# Altium project Grantiot.PrjPcb (part 2 of 2)

## Sheet Controller_Section.SchDoc
size A4; DocumentNumber: 4; SheetNumber: 5; SheetTotal: 9
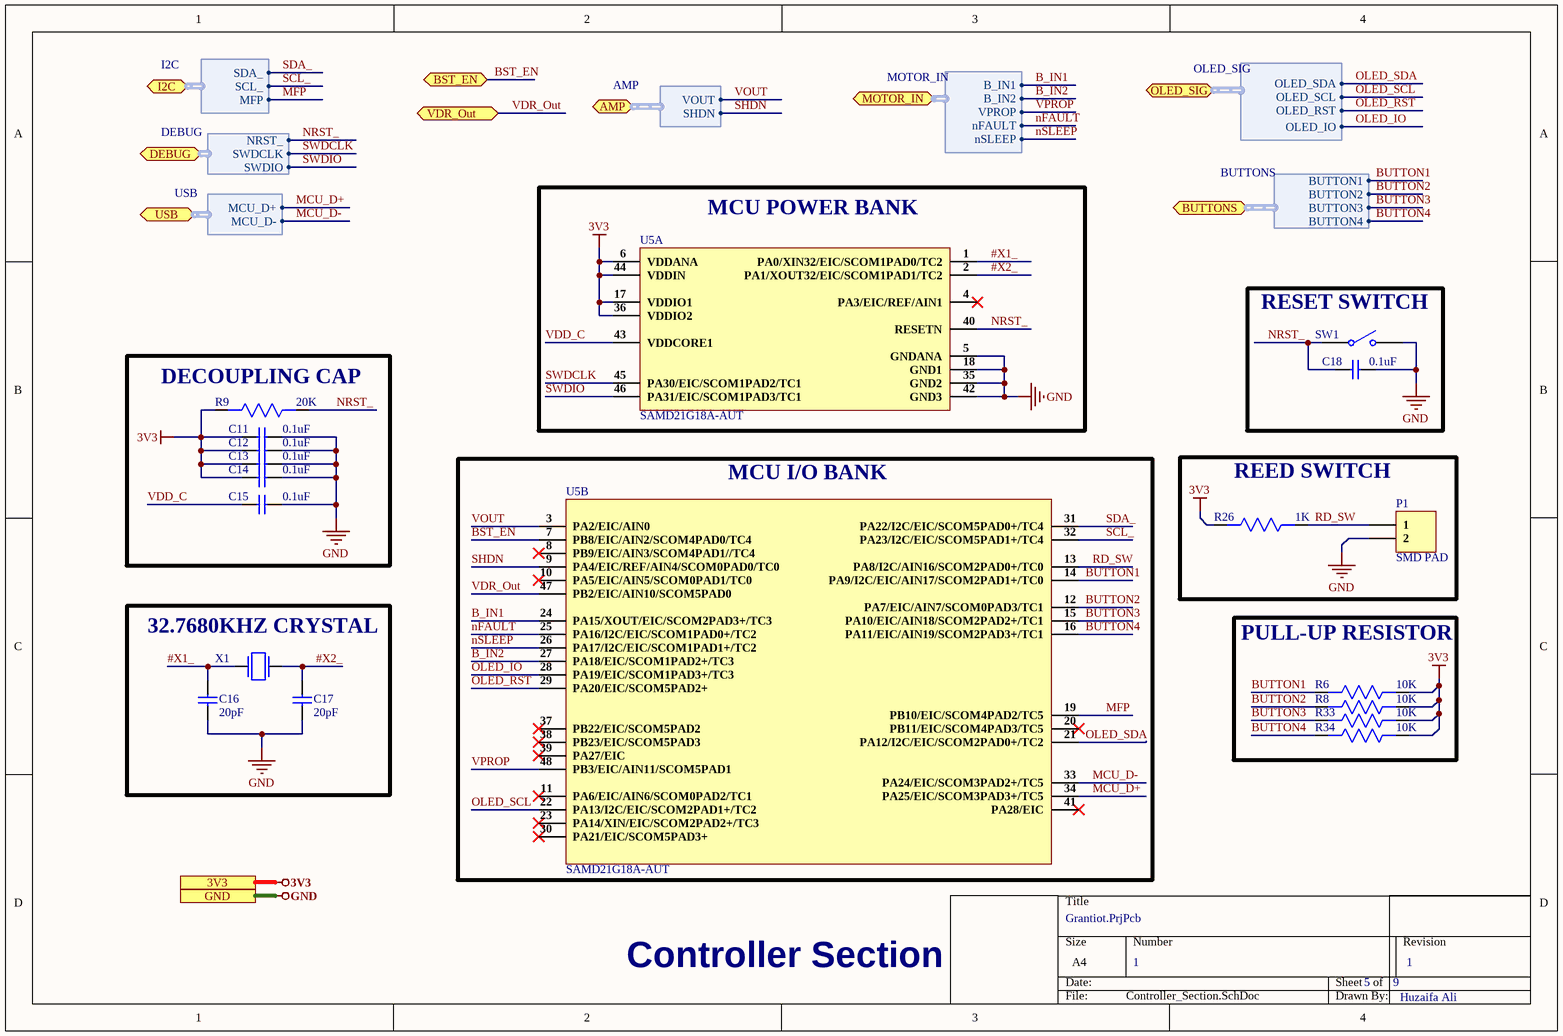
[diagram p3: Controller_Section.SchDoc]

### Parts
C11  0.1uF  [Cap 0402]
C12  0.1uF  [Cap 0402]
C13  0.1uF  [Cap 0402]
C14  0.1uF  [Cap 0402]
C15  0.1uF  [Cap 0402]
C16  20pF  [Cap 0201]
C17  20pF  [Cap 0201]
C18  0.1uF  [Cap 0402]
P1  SMD PAD  [SMD PAD]
R6  10K  [Res0402]
R8  10K  [Res0402]
R9  20K  [Res0402]
R26  1K  [Res0402]
R33  10K  [Res0402]
R34  10K  [Res0402]
SW1  B3U-1000P  [B3U-1000P]  (value not drawn)
U5  SAMD21G18A-AUT  [SAMD21G18A-AUT]  (parts A,B of 2)
X1  NX3215SA-32.768K-STD-MUA-8  [NX3215SA-32.768K-STD-MUA-8]  (value not drawn)

### Blocks framed on the sheet
MCU POWER BANK: U5
RESET SWITCH: C18 SW1
DECOUPLING CAP: C11-C15 R9
MCU I/O BANK: U5
REED SWITCH: P1 R26
32.7680KHZ CRYSTAL: C16 C17 X1
PULL-UP RESISTOR: R6 R8 R33 R34

### Ports
3V3, AMP (bidir, harness AMP), BST_EN (bidir), BUTTONS (bidir, harness BUTTONS), DEBUG (bidir, harness DEBUG), GND, I2C (bidir, harness I2C), MOTOR_IN (bidir, harness MOTOR_IN), OLED_SIG (bidir, harness OLED_SIG), USB (bidir, harness USB), VDR_Out (bidir)

### Harnesses
USB: MCU_D+, MCU_D-
DEBUG: NRST_, SWDCLK, SWDIO
I2C: SDA_, SCL_, MFP
AMP: VOUT, SHDN
MOTOR_IN: B_IN1, B_IN2, VPROP, nFAULT, nSLEEP
OLED_SIG: OLED_SDA, OLED_SCL, OLED_RST, OLED_IO
BUTTONS: BUTTON1, BUTTON2, BUTTON3, BUTTON4

### Nets
3V3: C11.1 C12.1 C13.1 C14.1 R6.1 R8.1 R9.2 R26.2 R33.1 R34.1 U5.6(VDDANA) U5.17(VDDIO1) U5.36(VDDIO2) U5.44(VDDIN) ; port 3V3
GND: C11.2 C12.2 C13.2 C14.2 C15.2 C16.1 C17.1 C18.2 P1.2 SW1.2 U5.5(GNDANA) U5.18(GND1) U5.35(GND2) U5.42(GND3) ; port GND
#X1_: C16.2 U5.1(PA0/XIN32/EIC/SCOM1PAD0/TC2) X1.2
#X2_: C17.2 U5.2(PA1/XOUT32/EIC/SCOM1PAD1/TC2) X1.1
B_IN1: U5.24(PA15/XOUT/EIC/SCOM2PAD3+/TC3) ; port MOTOR_IN.B_IN1
B_IN2: U5.27(PA18/EIC/SCOM1PAD2+/TC3) ; port MOTOR_IN.B_IN2
BST_EN: U5.7(PB8/EIC/AIN2/SCOM4PAD0/TC4) ; port BST_EN
BUTTON1: R6.2 U5.14(PA9/I2C/EIC/AIN17/SCOM2PAD1+/TC0) ; port BUTTONS.BUTTON1
BUTTON2: R8.2 U5.12(PA7/EIC/AIN7/SCOM0PAD3/TC1) ; port BUTTONS.BUTTON2
BUTTON3: R33.2 U5.15(PA10/EIC/AIN18/SCOM2PAD2+/TC1) ; port BUTTONS.BUTTON3
BUTTON4: R34.2 U5.16(PA11/EIC/AIN19/SCOM2PAD3+/TC1) ; port BUTTONS.BUTTON4
MCU_D+: U5.34(PA25/EIC/SCOM3PAD3+/TC5) ; port USB.MCU_D+
MCU_D-: U5.33(PA24/EIC/SCOM3PAD2+/TC5) ; port USB.MCU_D-
MFP: U5.19(PB10/EIC/SCOM4PAD2/TC5) ; port I2C.MFP
nFAULT: U5.25(PA16/I2C/EIC/SCOM1PAD0+/TC2) ; port MOTOR_IN.nFAULT
NRST_: C18.1 R9.1 SW1.1 U5.40(RESETN) ; port DEBUG.NRST_
nSLEEP: U5.26(PA17/I2C/EIC/SCOM1PAD1+/TC2) ; port MOTOR_IN.nSLEEP
OLED_IO: U5.28(PA19/EIC/SCOM1PAD3+/TC3) ; port OLED_SIG.OLED_IO
OLED_RST: U5.29(PA20/EIC/SCOM5PAD2+) ; port OLED_SIG.OLED_RST
OLED_SCL: U5.22(PA13/I2C/EIC/SCOM2PAD1+/TC2) ; port OLED_SIG.OLED_SCL
OLED_SDA: U5.21(PA12/I2C/EIC/SCOM2PAD0+/TC2) ; port OLED_SIG.OLED_SDA
RD_SW: P1.1 R26.1 U5.13(PA8/I2C/AIN16/SCOM2PAD0+/TC0)
SCL_: U5.32(PA23/I2C/EIC/SCOM5PAD1+/TC4) ; port I2C.SCL_
SDA_: U5.31(PA22/I2C/EIC/SCOM5PAD0+/TC4) ; port I2C.SDA_
SHDN: U5.9(PA4/EIC/REF/AIN4/SCOM0PAD0/TC0) ; port AMP.SHDN  [project net AMP.SHDN]
SWDCLK: U5.45(PA30/EIC/SCOM1PAD2/TC1) ; port DEBUG.SWDCLK
SWDIO: U5.46(PA31/EIC/SCOM1PAD3/TC1) ; port DEBUG.SWDIO
VDD_C: C15.1 U5.43(VDDCORE1)
VDR_Out: U5.47(PB2/EIC/AIN10/SCOM5PAD0) ; port VDR_Out
VOUT: U5.3(PA2/EIC/AIN0) ; port AMP.VOUT  [project net AMP.VOUT]
VPROP: U5.48(PB3/EIC/AIN11/SCOM5PAD1) ; port MOTOR_IN.VPROP

Not connected (* = marked no-connect by the designer): U5 4(PA3/EIC/REF/AIN1)* 8(PB9/EIC/AIN3/SCOM4PAD1//TC4)* 10(PA5/EIC/AIN5/SCOM0PAD1/TC0)* 11(PA6/EIC/AIN6/SCOM0PAD2/TC1)* 20(PB11/EIC/SCOM4PAD3/TC5)* 23(PA14/XIN/EIC/SCOM2PAD2+/TC3)* 30(PA21/EIC/SCOM5PAD3+)* 37(PB22/EIC/SCOM5PAD2)* 38(PB23/EIC/SCOM5PAD3)* 39(PA27/EIC)* 41(PA28/EIC)*

### Notes on the sheet
- Controller Section
- 1
- Huzaifa Ali

### Library data of the parts
C11-C15 C18 = CC0402KRX7R7BB104: CAP CER 0.1UF 16V X7R 0402; Manufacturer: Yageo; Tolerance: 10%; Capacitance: 100nF; Supplier 1: Digi-Key; Manufacturer Part Number: CC0402KRX7R7BB104; Stock 1: 16982736; Pricing 1: 1=0.1, 10=0.034, 100=0.015, 500=0.0107, 1000=0.00841, 2500=0.00764, 5000=0.00703 (USD); Mount: Surface Mount; Case/Package: 0402; Number of Pins: 2; Case Code (Metric): 1005; Case Code (Imperial): 0402; Min Operating Temperature: -55°C; Max Operating Temperature: 125°C; Dielectric: X7R; Voltage Rating: 16V; Voltage Rating (DC): 16V; Packaging: Tape and Reel; Package Quantity: 1; Termination: SMD/SMT; Composition: Ceramic; Voltage: 16V; Length: 1mm; Height: 0.5mm; Width: 0.02inch; Thickness: 0.022inch; Depth: 0.5mm; Radiation Hardening: No; REACH SVHC: No SVHC; Lead Free: Lead Free; Halogen Free: Halogen Free; ComponentLink1URL: http://www.yageo.com/documents/recent/UPY-GPHC_X7R_6.3V-to-50V_8.pdf?src-supplier=Avnet+Europe; ComponentLink1Description: http://www.yageo.com/documents/recent/UPY-GPHC_X7R_6.3V-to-50V_8.pdf?src-supplier=Avnet+Europe; ComponentLink2URL: http://www.yageo.com/documents/recent/UPY-GPHC_X7R_6.3V-to-50V_18.pdf?src-supplier=Digi-Key; ComponentLink2Description: http://www.yageo.com/documents/recent/UPY-GPHC_X7R_6.3V-to-50V_18.pdf?src-supplier=Digi-Key; ComponentLink3URL: http://www.yageo.com/documents/recent/UPY-GPHC_X7R_6.3V-to-50V_8.pdf?src-supplier=Avnet; ComponentLink3Description: http://www.yageo.com/documents/recent/UPY-GPHC_X7R_6.3V-to-50V_8.pdf?src-supplier=Avnet; ComponentLink4URL: http://www.yageo.com/documents/recent/UPY-GPHC_X7R_6.3V-to-50V_18.pdf?src-supplier=Mouser; ComponentLink4Description: http://www.yageo.com/documents/recent/UPY-GPHC_X7R_6.3V-to-50V_18.pdf?src-supplier=Mouser; ComponentLink5URL: http://www.farnell.com/datasheets/2167236.pdf?src-supplier=Element14; ComponentLink5Description: http://www.farnell.com/datasheets/2167236.pdf?src-supplier=Element14; ComponentLink6URL: http://www.farnell.com/datasheets/1489800.pdf?src-supplier=Element14; ComponentLink6Description: http://www.farnell.com/datasheets/1489800.pdf?src-supplier=Element14; Supplier Part Number 1: 311-1338-1-ND
C16 C17 = GJM0336C1E200JB01D: CAP CER 20PF 25V C0H 0201; Manufacturer: Murata; Tolerance: 5%; Supplier 1: Digi-Key; Manufacturer Part Number: GJM0336C1E200JB01D; Stock 1: 13650; Pricing 1: 1=0.1, 10=0.074, 100=0.0329, 500=0.02348, 1000=0.01845, 2500=0.01678, 5000=0.01543 (USD); Mount: Surface Mount; Case/Package: 0201; Case Code (Metric): 0603; Case Code (Imperial): 0201; Min Operating Temperature: -55°C; Max Operating Temperature: 125°C; Capacitance: 20pF; Voltage Rating: 25V; Packaging: Tape and Reel; Termination: SMD/SMT; Voltage Rating (DC): 25V; Length: 0.024inch; Width: 0.012inch; Thickness: 0.013inch; Lead Free: Lead Free; ComponentLink1URL: http://www.mouser.com/ds/2/281/c02e-2905.pdf?src-supplier=Mouser; ComponentLink1Description: http://www.mouser.com/ds/2/281/c02e-2905.pdf?src-supplier=Mouser; ComponentLink2URL: http://search.murata.co.jp/Ceramy/image/img/A01X/partnumbering_e_01.pdf?src-supplier=Digi-Key; ComponentLink2Description: http://search.murata.co.jp/Ceramy/image/img/A01X/partnumbering_e_01.pdf?src-supplier=Digi-Key; Supplier Part Number 1: 490-13313-1-ND
P1 = SMD PAD: Wire Connecting Pad
R6 R8 R33 R34 = RK73B1ETTP103J: RES 10K OHM 5% 1/10W 0402; Manufacturer: KOA Speer; Resistance: 10kR; Power Rating: 63mW; Voltage Rating: 50V; Temperature Coefficient: 200ppm/°C; Supplier 1: Digi-Key; Manufacturer Part Number: RK73B1ETTP103J; Stock 1: 2917894; Pricing 1: 1=0.1, 10=0.016, 100=0.0065, 1000=0.00292, 2500=0.00253, 5000=0.00209 (USD); Mount: Surface Mount; Case/Package: 0402; Case Code (Imperial): 0402; Case Code (Metric): 1005; Min Operating Temperature: -55°C; Max Operating Temperature: 155°C; Packaging: Tape and Reel; Tolerance: 5%; Package Quantity: 10000; Composition: Thick Film; Termination: SMD/SMT; Military Standard: Not; Voltage Rating (DC): 50V; Length: 1mm; Height: 0.35mm; Width: 0.5mm; Depth: 0.5mm; Lead Free: Lead Free; ComponentLink1URL: https://www.verical.com/server-webapp/html/getDatasheet?partID=89073&src-supplier=Verical; ComponentLink1Description: https://www.verical.com/server-webapp/html/getDatasheet?partID=89073&src-supplier=Verical; Supplier Part Number 1: 2019-RK73B1ETTP103JCT-ND
R9 = RC0402JR-0720KL: RES SMD 20K OHM 5% 1/16W 0402; Manufacturer: Yageo; Resistance: 20kR; Power Rating: 62.5mW; Voltage Rating: 50V; Temperature Coefficient: 100ppm/°C; Max Power Dissipation: 63mW; Supplier 1: Digi-Key; Manufacturer Part Number: RC0402JR-0720KL; Stock 1: 4817510; Pricing 1: 1=0.1, 10=0.013, 100=0.0053, 1000=0.00236, 2500=0.00205, 5000=0.00169 (USD); Case/Package: 0402; Number of Pins: 2; Case Code (Metric): 1005; Case Code (Imperial): 0402; Min Operating Temperature: -55°C; Max Operating Temperature: 155°C; Package Quantity: 1; Tolerance: 5%; Packaging: Tape and Reel; Composition: Thick Film; Number of Terminations: 2; Termination: SMD/SMT; Military Standard: Not; Voltage Rating (DC): 50V; Features: Moisture Resistant; Length: 0.039inch; Height: 0.016inch; Width: 0.02inch; Depth: 0.5mm; REACH SVHC: No SVHC; Lead Free: Lead Free; ComponentLink1URL: http://www.yageo.com/documents/recent/PYu-RC_Group_51_RoHS_L_9.pdf?src-supplier=Digi-Key; ComponentLink1Description: http://www.yageo.com/documents/recent/PYu-RC_Group_51_RoHS_L_9.pdf?src-supplier=Digi-Key; ComponentLink2URL: http://www.farnell.com/datasheets/1018594.pdf?src-supplier=Element14; ComponentLink2Description: http://www.farnell.com/datasheets/1018594.pdf?src-supplier=Element14; ComponentLink3URL: http://www.mouser.com/ds/2/447/PYu-RC0402_51_RoHS_L_6_r-8721.pdf?src-supplier=Mouser; ComponentLink3Description: http://www.mouser.com/ds/2/447/PYu-RC0402_51_RoHS_L_6_r-8721.pdf?src-supplier=Mouser; ComponentLink4URL: http://www.yageo.com/documents/recent/PYu-RC0402_51_RoHS_L_6_r.pdf?src-supplier=Future+Electronics; ComponentLink4Description: http://www.yageo.com/documents/recent/PYu-RC0402_51_RoHS_L_6_r.pdf?src-supplier=Future+Electronics; Supplier Part Number 1: 311-20KJRCT-ND
R26 = ERJ-2GEJ102X: RES SMD 1K OHM 5% 1/10W 0402; Manufacturer: Panasonic; Resistance: 1kR; Temperature Coefficient: 200ppm/°C; Voltage Rating: 50V; Power Rating: 100mW; Supplier 1: Digi-Key; Manufacturer Part Number: ERJ-2GEJ102X; Stock 1: 3855795; Pricing 1: 1=0.1, 10=0.032, 100=0.0129, 1000=0.00578, 2500=0.00502, 5000=0.00414 (USD); Mount: Surface Mount; Case/Package: 0402; Contact Plating: Tin; Case Code (Metric): 1005; Case Code (Imperial): 0402; Min Operating Temperature: -55°C; Max Operating Temperature: 155°C; Tolerance: 5%; Composition: Thick Film; Packaging: Tape and Reel; Package Quantity: 1; Number of Terminations: 2; Termination: SMD/SMT; Military Standard: Not; Max Power Dissipation: 100mW; Voltage Rating (DC): 50V; Features: Automotive AEC-Q200; Working Voltage: 50V; Length: 1mm; Height: 0.35mm; Width: 0.02inch; Depth: 0.5mm; Radiation Hardening: No; REACH SVHC: No SVHC; Lead Free: Lead Free; ComponentLink1URL: https://industrial.panasonic.com/cdbs/www-data/pdf/RDA0000/AOA0000C301.pdf?src-supplier=Future+Electronics; ComponentLink1Description: https://industrial.panasonic.com/cdbs/www-data/pdf/RDA0000/AOA0000C301.pdf?src-supplier=Future+Electronics; ComponentLink2URL: http://www.jameco.com/Jameco/Products/ProdDS/1986781.pdf?src-supplier=Jameco; ComponentLink2Description: http://www.jameco.com/Jameco/Products/ProdDS/1986781.pdf?src-supplier=Jameco; ComponentLink3URL: http://www.farnell.com/datasheets/2059623.pdf?src-supplier=Farnell; ComponentLink3Description: http://www.farnell.com/datasheets/2059623.pdf?src-supplier=Farnell; ComponentLink4URL: http://industrial.panasonic.com/www-data/pdf/AOA0000/AOA0000CE1.pdf?src-supplier=Avnet; ComponentLink4Description: http://industrial.panasonic.com/www-data/pdf/AOA0000/AOA0000CE1.pdf?src-supplier=Avnet; ComponentLink5URL: http://www.alliedelec.com/m/d/51cd0790071e1666bdb9d00c57fcf960.pdf?src-supplier=Allied+Electronics; ComponentLink5Description: http://www.alliedelec.com/m/d/51cd0790071e1666bdb9d00c57fcf960.pdf?src-supplier=Allied+Electronics; ComponentLink6URL: http://industrial.panasonic.com/www-data/pdf/AOA0000/AOA0000CE1.pdf?src-supplier=Avnet+Europe; ComponentLink6Description: http://industrial.panasonic.com/www-data/pdf/AOA0000/AOA0000CE1.pdf?src-supplier=Avnet+Europe; ComponentLink7URL: http://www.farnell.com/datasheets/2059623.pdf?src-supplier=Element14; ComponentLink7Description: http://www.farnell.com/datasheets/2059623.pdf?src-supplier=Element14; ComponentLink8URL: http://industrial.panasonic.com/cdbs/www-data/pdf/RDA0000/AOA0000C301.pdf?src-supplier=Farnell; ComponentLink8Description: http://industrial.panasonic.com/cdbs/www-data/pdf/RDA0000/AOA0000C301.pdf?src-supplier=Farnell; ComponentLink9URL: http://industrial.panasonic.com/www-data/pdf/AOA0000/AOA0000CE1.pdf?src-supplier=Avnet+Asia; ComponentLink9Description: http://industrial.panasonic.com/www-data/pdf/AOA0000/AOA0000CE1.pdf?src-supplier=Avnet+Asia; Supplier Part Number 1: P1.0KJCT-ND
SW1 = B3U-1000P: SWITCH TACTILE SPST-NO 0.05A 12V; Manufacturer: Omron; Mechanical Life: 200000Cycles; Operating Force: 1.5N; Throw Configuration: SPST; Current Rating: 50mA; Contact Resistance: 100mR; Illumination Type: Non-Illuminated,Illuminated; Switch Travel: 0.15mm; Switch Function: Off-Mom; Actuator Type: Standard; Actuator Length: 0.4mm; Ratings: Dust Proof,IP40; ComponentLink1URL: http://www.farnell.com/datasheets/60838.pdf?src-supplier=Farnell; ComponentLink1Description: http://www.farnell.com/datasheets/60838.pdf?src-supplier=Farnell; ComponentLink2URL: http://www.farnell.com/datasheets/60838.pdf?src-supplier=Element14; ComponentLink2Description: http://www.farnell.com/datasheets/60838.pdf?src-supplier=Element14; ComponentLink3URL: https://omronfs.omron.com/en_US/ecb/products/pdf/en-b3u.pdf?src-supplier=Digi-Key; ComponentLink3Description: https://omronfs.omron.com/en_US/ecb/products/pdf/en-b3u.pdf?src-supplier=Digi-Key; ComponentLink4URL: http://www.omron.com/ecb/products/pdf/en-b3u.pdf?src-supplier=Digi-Key; ComponentLink4Description: http://www.omron.com/ecb/products/pdf/en-b3u.pdf?src-supplier=Digi-Key; ComponentLink5URL: https://www.distrelec.biz/Web/Downloads/he/et/B3U_eng_datasheet.pdf?mime=application%2Fpdf&src-supplier=Distrelec; ComponentLink5Description: https://www.distrelec.biz/Web/Downloads/he/et/B3U_eng_datasheet.pdf?mime=application%2Fpdf&src-supplier=Distrelec; ComponentLink6URL: http://www.onlinecomponents.com/productFiles/mf-OM/en-b3u.pdf?src-supplier=Onlinecomponents.com; ComponentLink6Description: http://www.onlinecomponents.com/productFiles/mf-OM/en-b3u.pdf?src-supplier=Onlinecomponents.com; Supplier 1: Digi-Key; Manufacturer Part Number: B3U-1000P; Stock 1: 116454; Pricing 1: 1=1, 10=0.961, 25=0.9064, 50=0.7976, 100=0.7251, 250=0.68888, 500=0.67074, 1000=0.52571 (USD); Mount: Surface Mount; Weight: 0.000776oz; Contact Material: Silver; Min Operating Temperature: -25°C; Max Operating Temperature: 70°C; Packaging: Tape and Reel; Voltage Rating (DC): 12V; Package Quantity: 1; Max Current Rating: 50mA; Termination: SMD/SMT; Orientation: Straight; Max Voltage Rating (DC): 12V; Electrical Life: 200000Cycles; Insulation Resistance: 100MR; Contact Current Rating: 50mA; Length: 4mm; Height: 1.2mm; Depth: 2.5mm; Width: 3mm; REACH SVHC: Unknown; Lead Free: Lead Free; ComponentLink7URL: https://www.verical.com/server-webapp/html/getDatasheet?partID=552554&src-supplier=Verical; ComponentLink7Description: https://www.verical.com/server-webapp/html/getDatasheet?partID=552554&src-supplier=Verical; ComponentLink8URL: http://www.farnell.com/datasheets/1685550.pdf?src-supplier=Element14; ComponentLink8Description: http://www.farnell.com/datasheets/1685550.pdf?src-supplier=Element14; ComponentLink9URL: http://www.farnell.com/datasheets/2610940.pdf?src-supplier=Farnell; ComponentLink9Description: http://www.farnell.com/datasheets/2610940.pdf?src-supplier=Farnell; ComponentLink10URL: https://www.alliedelec.com/m/d/4c8a9ef82804fc3c241a13c1e298fd73.pdf?src-supplier=Allied+Electronics; ComponentLink10Description: https://www.alliedelec.com/m/d/4c8a9ef82804fc3c241a13c1e298fd73.pdf?src-supplier=Allied+Electronics; Supplier Part Number 1: SW1020DKR-ND
U5 = SAMD21G18A-AUT: IC MCU 32BIT 256KB FLASH 48TQFP; Manufacturer: Microchip; Manufacturer Part Number: ATSAMD21G18A-AUT; Supplier 1: Digi-Key; Stock 1: 4547; Pricing 1: 1=3.32, 25=3.0104, 100=2.7348 (USD); ComponentLink1URL: http://www.microchip.com/mymicrochip/filehandler.aspx?ddocname=en590210; ComponentLink1Description: http://www.microchip.com/mymicrochip/filehandler.aspx?ddocname=en590210; Supplier Part Number 1: ATSAMD21G18A-AUTDKR-ND
X1 = NX3215SA-32.768K-STD-MUA-8: CRYSTAL 32.7680KHZ 12.5PF SMD; Manufacturer: NDK; Frequency: 32.768kHz; Frequency Tolerance: 20ppm; ESR (Equivalent Series Resistance): 70kR; Supplier 1: Digi-Key; Manufacturer Part Number: NX3215SA-32.768K-STD-MUA-8; Stock 1: 29951; Pricing 1: 1=0.68, 10=0.602, 50=0.5628, 100=0.4974, 500=0.47124, 1000=0.3927 (USD); Mount: Surface Mount; Case/Package: SMD/SMT; Number of Pins: 2; Min Operating Temperature: -40°C; Max Operating Temperature: 85°C; Package Quantity: 1000; Load Capacitance: 12.5pF; Packaging: Tape and Reel; Length: 0.126inch; Height: 0.035inch; Width: 0.059inch; Lead Free: Lead Free; ComponentLink1URL: https://media.digikey.com/pdf/Data%20Sheets/NDK%20PDFs/NX3215SA-32.768K-STD-MUA-8.pdf?src-supplier=Digi-Key; ComponentLink1Description: https://media.digikey.com/pdf/Data%20Sheets/NDK%20PDFs/NX3215SA-32.768K-STD-MUA-8.pdf?src-supplier=Digi-Key; ComponentLink2URL: http://www.ndk.com/images/products/catalog/c_NX3215SA-STD-MUA-14_e.pdf?src-supplier=Digi-Key; ComponentLink2Description: http://www.ndk.com/images/products/catalog/c_NX3215SA-STD-MUA-14_e.pdf?src-supplier=Digi-Key; Supplier Part Number 1: 644-1156-6-ND

## Sheet Connector_Section.SchDoc
size A4; DocumentNumber: 7; SheetNumber: 7; SheetTotal: 9
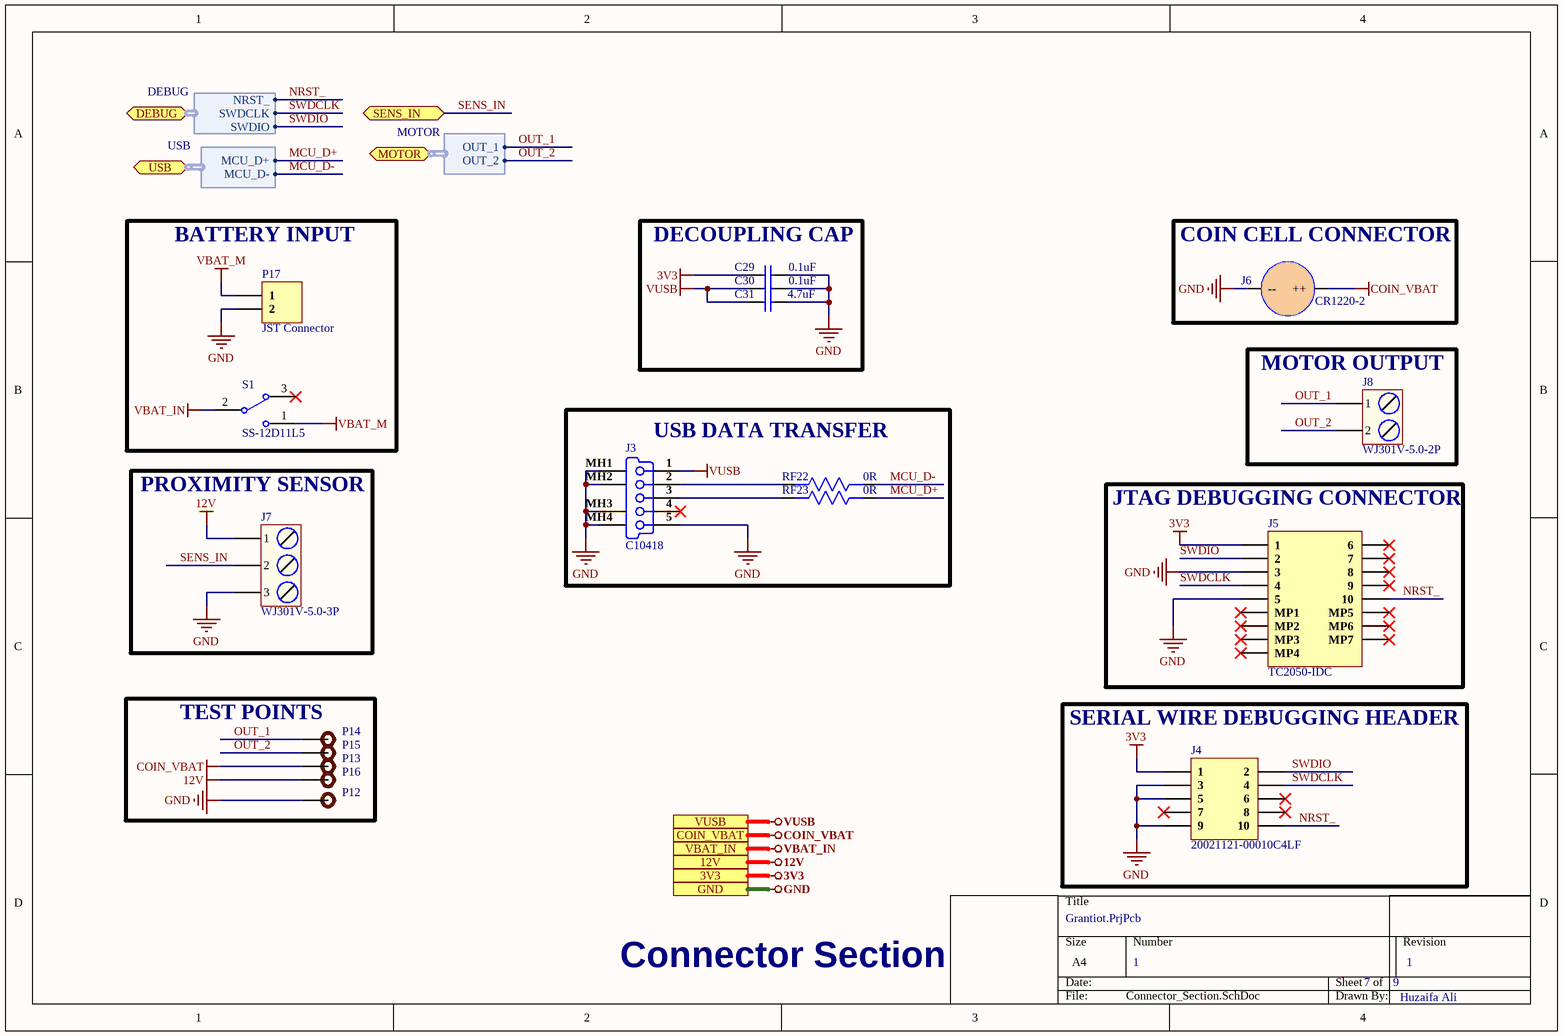
[diagram p4: Connector_Section.SchDoc]

### Parts
C29  0.1uF  [Cap 0402]
C30  0.1uF  [Cap 0402]
C31  4.7uF  [Cap 0603]
J3  C10418  [C10418]
J4  20021121-00010C4LF  [20021121-00010C4LF]
J5  TC2050-IDC  [TC2050-IDC]
J6  CR1220-2  [CR1220-2]
J7  WJ301V-5.0-3P  [WJ301V-5.0-3P]
J8  WJ301V-5.0-2P  [WJ301V-5.0-2P]
P12  Test Point  [TEST POINT]  (value not drawn)
P13  Test Point  [TEST POINT]  (value not drawn)
P14  Test Point  [TEST POINT]  (value not drawn)
P15  Test Point  [TEST POINT]  (value not drawn)
P16  Test Point  [TEST POINT]  (value not drawn)
P17  JST Connector  [JST Connector]
RF22  0R  [Res0402]
RF23  0R  [Res0402]
S1  SS-12D11L5  [SS-12D11L5]

### Blocks framed on the sheet
BATTERY INPUT: P17 S1
DECOUPLING CAP: C29-C31
COIN CELL CONNECTOR: J6
MOTOR OUTPUT: J8
USB DATA TRANSFER: J3 RF22 RF23
PROXIMITY SENSOR: J7
JTAG DEBUGGING CONNECTOR: J5
TEST POINTS: P12-P16
SERIAL WIRE DEBUGGING HEADER: J4

### Ports
3V3, 12V, COIN_VBAT, DEBUG (bidir, harness DEBUG), GND, MOTOR (bidir, harness MOTOR), SENS_IN (bidir), USB (bidir, harness USB), VBAT_IN, VUSB

### Harnesses
DEBUG: NRST_, SWDCLK, SWDIO
USB: MCU_D+, MCU_D-
MOTOR: OUT_1, OUT_2

### Nets
3V3: C29.1 J4.1 J5.1 ; port 3V3
12V: J7.1 P16.1 ; port 12V
COIN_VBAT: J6.1(++) P13.1 ; port COIN_VBAT
GND: C29.2 C30.2 C31.2 J3.5(GND) J3.MH1(Tab) J3.MH2(Tab) J3.MH3(Tab) J3.MH4(Tab) J4.3 J4.5 J4.9 J5.3 J5.5 J6.2(--) J7.3 P12.1 P17.2 ; port GND
VBAT_IN: S1.2 ; port VBAT_IN  [project net 3V3ZD]
VBAT_M: P17.1 S1.1
VUSB: C30.1 C31.1 J3.1(V_BUS_(5V)) ; port VUSB  [project net VSUB]
MCU_D+: RF23.1 ; port USB.MCU_D+
MCU_D-: RF22.1 ; port USB.MCU_D-
NRST_: J4.10 J5.10 ; port DEBUG.NRST_
OUT_1: J8.1 P14.1 ; port MOTOR.OUT_1
OUT_2: J8.2 P15.1 ; port MOTOR.OUT_2
SENS_IN: J7.2 ; port SENS_IN
SWDCLK: J4.4 J5.4 ; port DEBUG.SWDCLK
SWDIO: J4.2 J5.2 ; port DEBUG.SWDIO
NetJ3_2: J3.2(D-) RF22.2
NetJ3_3: J3.3(D+) RF23.2

Not connected (* = marked no-connect by the designer): J3 4(NC)*; J4 6* 7* 8*; J5 6* 7* 8* 9* MP1* MP2* MP3* MP4* MP5* MP6* MP7*; J6 MH1 MH2; S1 3*

### Notes on the sheet
- Connector Section
- 1
- Huzaifa Ali

### Library data of the parts
C29 C30 = CC0402KRX7R7BB104: as C11 on sheet Controller_Section; Supplier 1: Digi-Key; Manufacturer Part Number: CC0402KRX7R7BB104; Stock 1: 16982736; Pricing 1: 1=0.1, 10=0.034, 100=0.015, 500=0.0107, 1000=0.00841, 2500=0.00764, 5000=0.00703 (USD); Mount: Surface Mount; Case/Package: 0402; Number of Pins: 2; Case Code (Metric): 1005; Case Code (Imperial): 0402; Min Operating Temperature: -55°C; Max Operating Temperature: 125°C; Dielectric: X7R; Voltage Rating: 16V; Voltage Rating (DC): 16V; Packaging: Tape and Reel; Package Quantity: 1; Termination: SMD/SMT; Composition: Ceramic; Voltage: 16V; Length: 1mm; Height: 0.5mm; Width: 0.02inch; Thickness: 0.022inch; Depth: 0.5mm; Radiation Hardening: No; REACH SVHC: No SVHC; Lead Free: Lead Free; Halogen Free: Halogen Free; ComponentLink1URL: http://www.yageo.com/documents/recent/UPY-GPHC_X7R_6.3V-to-50V_8.pdf?src-supplier=Avnet+Europe; ComponentLink1Description: http://www.yageo.com/documents/recent/UPY-GPHC_X7R_6.3V-to-50V_8.pdf?src-supplier=Avnet+Europe; ComponentLink2URL: http://www.yageo.com/documents/recent/UPY-GPHC_X7R_6.3V-to-50V_18.pdf?src-supplier=Digi-Key; ComponentLink2Description: http://www.yageo.com/documents/recent/UPY-GPHC_X7R_6.3V-to-50V_18.pdf?src-supplier=Digi-Key; ComponentLink3URL: http://www.yageo.com/documents/recent/UPY-GPHC_X7R_6.3V-to-50V_8.pdf?src-supplier=Avnet; ComponentLink3Description: http://www.yageo.com/documents/recent/UPY-GPHC_X7R_6.3V-to-50V_8.pdf?src-supplier=Avnet; ComponentLink4URL: http://www.yageo.com/documents/recent/UPY-GPHC_X7R_6.3V-to-50V_18.pdf?src-supplier=Mouser; ComponentLink4Description: http://www.yageo.com/documents/recent/UPY-GPHC_X7R_6.3V-to-50V_18.pdf?src-supplier=Mouser; ComponentLink5URL: http://www.farnell.com/datasheets/2167236.pdf?src-supplier=Element14; ComponentLink5Description: http://www.farnell.com/datasheets/2167236.pdf?src-supplier=Element14; ComponentLink6URL: http://www.farnell.com/datasheets/1489800.pdf?src-supplier=Element14; ComponentLink6Description: http://www.farnell.com/datasheets/1489800.pdf?src-supplier=Element14; Supplier Part Number 1: 311-1338-1-ND
C31 = CL10A475KA8NQNC: CAP CER 4.7UF 25V X5R 0603; Manufacturer: Samsung; Tolerance: 10%; Supplier 1: Digi-Key; Manufacturer Part Number: CL10A475KA8NQNC; Stock 1: 2252340; Pricing 1: 1=0.37, 10=0.255, 100=0.1528, 500=0.11456, 1000=0.09675 (USD); Mount: Surface Mount; Case/Package: 0603; Case Code (Metric): 1608; Case Code (Imperial): 0603; Contact Plating: Tin; Min Operating Temperature: -55°C; Max Operating Temperature: 85°C; Package Quantity: 1; Packaging: Tape and Reel; Capacitance: 4.7uF; Voltage Rating: 25V; Dielectric: X5R; Termination: Wraparound; Length: 1.6mm; Width: 0.031inch; Thickness: 0.035inch; Depth: 0.8mm; Lead Free: Lead Free; ComponentLink1URL: http://www.samsungsem.com/kr/support/product-search/mlcc/CL10A475KA8NQNC.jsp?src-supplier=Digi-Key; ComponentLink1Description: http://www.samsungsem.com/kr/support/product-search/mlcc/CL10A475KA8NQNC.jsp?src-supplier=Digi-Key; Supplier Part Number 1: 1276-1900-1-ND
J3 = C10418: USB - Micro B Female USB 2 5 SMD USB Connectors RoHS; Manufacturer: Jing Extension of the Electronic Co.; Gender: Receptacle; Connector Type: USB,Receptacle; Number of Contacts: 5; Number of Ports: 1; Manufacturer Part Number: C10418; Mount: Surface Mount,Horizontal; Number of Terminals: 5; Termination: Solder; Orientation: Right Angle; ComponentLink1URL: http://www.amphenol-icc.com/media/wysiwyg/files/drawing/10118194.pdf?src-supplier=Digi-Key; ComponentLink1Description: http://www.amphenol-icc.com/media/wysiwyg/files/drawing/10118194.pdf?src-supplier=Digi-Key; ComponentLink2URL: https://cdn.amphenol-icc.com/media/wysiwyg/files/drawing/10118194.pdf?src-supplier=Mouser; ComponentLink2Description: https://cdn.amphenol-icc.com/media/wysiwyg/files/drawing/10118194.pdf?src-supplier=Mouser; ComponentLink3URL: https://cdn.amphenol-icc.com/media/wysiwyg/files/drawing/10118194.pdf?src-supplier=Verical; ComponentLink3Description: https://cdn.amphenol-icc.com/media/wysiwyg/files/drawing/10118194.pdf?src-supplier=Verical; Link: https://lcsc.com/product-detail/USB-Connectors_Jing-Extension-of-the-Electronic-Co-C10418_C10418.html
J4 = 20021121-00010C4LF: CONN HEADER SMD 10POS 1.27MM; Manufacturer: Amphenol FCI; Number of Contacts: 10; Contact Resistance: 30mR; Current Rating: 1A; Voltage Rating: 125V; Insulation Resistance: 100MR; Gender: Male; Connector Type: Male Pin,Header; Row Spacing: 0.05inch; Stack Height: 3mm; Supplier 1: Digi-Key; Manufacturer Part Number: 20021121-00010C4LF; Stock 1: 0; Pricing 1: 1=0.87, 10=0.761, 100=0.6563 (USD); Mount: Surface Mount; Contact Plating: Gold; Contact Material: Copper Alloy,Copper,Gold; Color: Black; Housing Color: Black; Housing Material: Thermoplastic; Min Operating Temperature: -40°C; Max Operating Temperature: 85°C; Number of Rows: 2; Termination: Solder; Packaging: Tape and Reel; Package Quantity: 600; Number of Positions: 10; Max Voltage Rating (AC): 125V; Orientation: Straight; Length: 6.35mm; Pitch: 1.27mm; Contact Mating Length: 0.12inch; Depth: 3.4mm; Radiation Hardening: No; REACH SVHC: No SVHC; ComponentLink1URL: https://www.verical.com/server-webapp/html/getDatasheet?partID=177140&src-supplier=Verical; ComponentLink1Description: https://www.verical.com/server-webapp/html/getDatasheet?partID=177140&src-supplier=Verical; ComponentLink2URL: http://portal.fciconnect.com/Comergent/fci/drawing/20021121.pdf?src-supplier=Avnet; ComponentLink2Description: http://portal.fciconnect.com/Comergent/fci/drawing/20021121.pdf?src-supplier=Avnet; ComponentLink3URL: https://cdn.amphenol-icc.com/media/wysiwyg/files/drawing/20021121.pdf?src-supplier=Digi-Key; ComponentLink3Description: https://cdn.amphenol-icc.com/media/wysiwyg/files/drawing/20021121.pdf?src-supplier=Digi-Key; ComponentLink4URL: http://portal.fciconnect.com/Comergent/fci/drawing/20021121.pdf?src-supplier=Avnet+Europe; ComponentLink4Description: http://portal.fciconnect.com/Comergent/fci/drawing/20021121.pdf?src-supplier=Avnet+Europe; ComponentLink5URL: https://media.digikey.com/pdf/Data%20Sheets/FCI%20PDFs/Minitek%20127_Catalog.pdf?src-supplier=Digi-Key; ComponentLink5Description: https://media.digikey.com/pdf/Data%20Sheets/FCI%20PDFs/Minitek%20127_Catalog.pdf?src-supplier=Digi-Key; ComponentLink6URL: http://portal.fciconnect.com/Comergent//fci/drawing/20021121.pdf?src-supplier=Mouser; ComponentLink6Description: http://portal.fciconnect.com/Comergent//fci/drawing/20021121.pdf?src-supplier=Mouser; Supplier Part Number 1: 609-3695-6-ND
J5 = TC2050-IDC: CBL PLUG-OF-NAILS 10-PIN W/LEGS; Manufacturer: Tag-Connect; Supplier 1: Digi-Key; Manufacturer Part Number: TC2050-IDC; Stock 1: 59; Pricing 1: 1=40.17 (USD); Package Quantity: 1; ComponentLink1URL: http://www.tag-connect.com/Materials/TC2050-IDC%20Datasheet.pdf?src-supplier=Digi-Key; ComponentLink1Description: http://www.tag-connect.com/Materials/TC2050-IDC%20Datasheet.pdf?src-supplier=Digi-Key; Supplier Part Number 1: TC2050-IDC-ND
J6 = CR1220-2: SMD Battery Holders, Clips & Contacts RoHS; Manufacturer: Q&J; Value: Cuctom; Manufacturer Part No: CR1220-2; Package: Cuctom
J7 = WJ301V-5.0-3P: P=5.0mm Screw terminal RoHS; Manufacturer: Ningbo Kangnex Elec; Value: Custom; Manufacturer Part No: WJ301V-5.0-3P; Package: Custom
J8 = WJ301V-5.0-2P: P=5.0mm Screw terminal RoHS; Manufacturer: Ningbo Kangnex Elec; Value: Custom; Manufacturer Part No: WJ301V-5.0-2P; Package: Custom
P12-P16 = TEST POINT: Test Point ON
P17 = 2 Pin JST Connector
RF22 RF23 = RC0402JR-070RL: RES SMD 0 OHM JUMPER 1/16W 0402; Manufacturer: Yageo; Manufacturer Part Number: RC0402FR-070RL; Resistance: 0mR; Tolerance: 1%; Power Rating: 62.5mW; Voltage Rating: 50V; Temperature Coefficient: 200ppm/°C; Supplier 1: Digi-Key; Stock 1: 3681314; Pricing 1: 1=0.1, 10=0.013, 25=0.0092, 50=0.0072, 100=0.0053, 250=0.004, 500=0.0032, 1000=0.00236, 5000=0.00169 (USD); Mount: Surface Mount; Case/Package: 0402; Contact Plating: Tin,Matte; Case Code (Imperial): 0402; Case Code (Metric): 1005; Min Operating Temperature: -55°C; Max Operating Temperature: 155°C; Composition: Thick Film; Packaging: Tape and Reel; Termination: SMD/SMT; Length: 1mm; Height: 0.35mm; Width: 0.5mm; Radiation Hardening: No; Lead Free: Lead Free; ComponentLink1URL: http://www.yageo.com/documents/recent/PYu-RC0402_51_RoHS_L_6.pdf?src-supplier=Avnet; ComponentLink1Description: http://www.yageo.com/documents/recent/PYu-RC0402_51_RoHS_L_6.pdf?src-supplier=Avnet; ComponentLink2URL: http://www.yageo.com/documents/recent/PYu-RC0402_51_RoHS_L_6_r.pdf?src-supplier=Future+Electronics; ComponentLink2Description: http://www.yageo.com/documents/recent/PYu-RC0402_51_RoHS_L_6_r.pdf?src-supplier=Future+Electronics; ComponentLink3URL: http://www.yageo.com/documents/recent/PYu-RC0402_51_RoHS_L_6.pdf?src-supplier=Avnet+Europe; ComponentLink3Description: http://www.yageo.com/documents/recent/PYu-RC0402_51_RoHS_L_6.pdf?src-supplier=Avnet+Europe; Supplier Part Number 1: 311-0.0LRCT-ND
S1 = SS-12D11L5: SPDT 5A 120V On-On DIP Toggle Switches RoHS; Manufacturer: XKB Enterprise; Value: Custom; Manufacturer Part No: SS-12D11L5; Package: Custom

## Sheet Audio_Amplifier_Section.SchDoc
size A4; DocumentNumber: 9; SheetNumber: 9; SheetTotal: 9
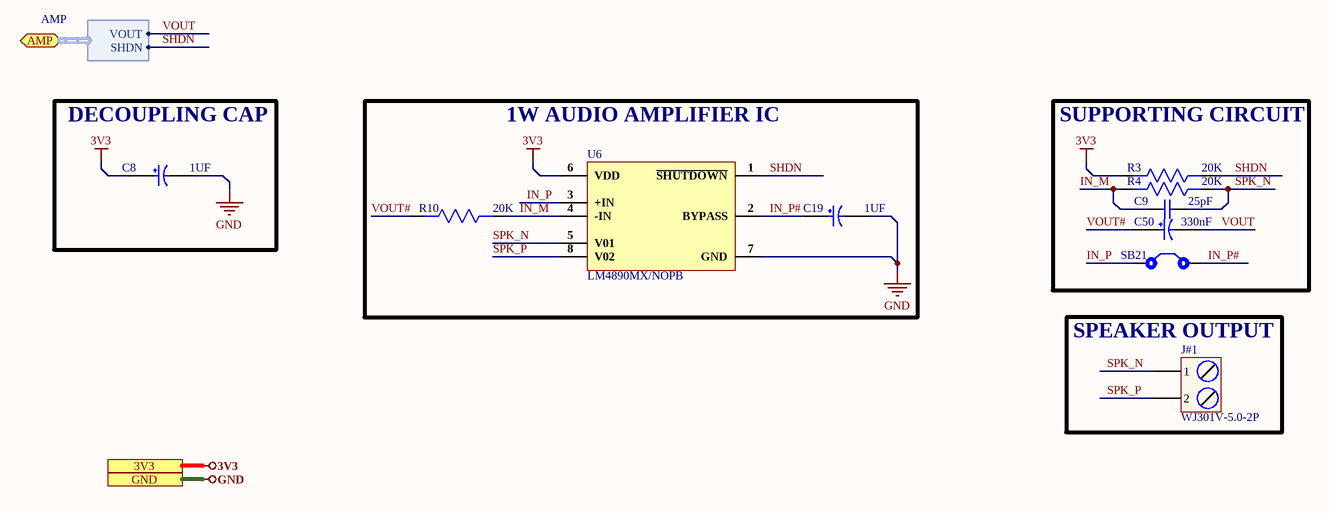
[diagram p5: Audio_Amplifier_Section.SchDoc]

### Parts
C8  1UF  [TCP1A105M8R]
C9  25pF  [Cap 0603]
C19  1UF  [TCP1A105M8R]
C50  330nF  [TCTU1D334M8R]
J#1  WJ301V-5.0-2P  [WJ301V-5.0-2P]
R3  20K  [Res0402]
R4  20K  [Res0402]
R10  20K  [Res0402]
SB21  Solder Bridge  [Solder Bridge]  (value not drawn)
U6  LM4890MX/NOPB  [SOIC-8]

### Blocks framed on the sheet
DECOUPLING CAP: C8
1W AUDIO AMPLIFIER IC: C19 R10 U6
SUPPORTING CIRCUIT: C9 C50 R3 R4 SB21
SPEAKER OUTPUT: J#1

### Ports
3V3, AMP (bidir, harness AMP), GND

### Harnesses
AMP: VOUT, SHDN

### Nets
3V3: C8.1 R3.2 U6.6(VDD) ; port 3V3
GND: C8.2 C19.2 U6.7(GND) ; port GND
IN_M: C9.1 R4.2 R10.1 U6.4(-IN)
IN_P: SB21.1 U6.3(+IN)
IN_P#: C19.1 SB21.2 U6.2(BYPASS)
SHDN: R3.1 U6.1(~{SHUTDO}~{WN}) ; port AMP.SHDN  [project net AMP.SHDN]
SPK_N: C9.2 J#1.1 R4.1 U6.5(V01)
SPK_P: J#1.2 U6.8(V02)
VOUT: C50.2 ; port AMP.VOUT  [project net AMP.VOUT]
VOUT#: C50.1 R10.2

### Notes on the sheet
- 1
- Huzaifa Ali

### Library data of the parts
C8 C19 = TCP1A105M8R: 1uF 10V ±20% 0805 Tantalum Capacitors ROHS; Manufacturer: ROHM; Manufacturer Part No: TCP1A105M8R; Package: 0805; Value: 1uF; ComponentLink1Description: LCSC; ComponentLink1URL: https://lcsc.com/product-detail/Tantalum-Capacitors_ROHM-Semicon-TCP1A105M8R_C1952948.html
C9 = CC0603JRNPO9BN250: CAP CER 25PF 50V C0G/NPO 0603; Manufacturer: YAGEO; Manufacturer Part No: CC0603JRNPO9BN250; Package: 0603; Value: 25pF
C50 = TCTU1D334M8R: CAP TANT 0.33 uF 20 V ±20% 0402; Manufacturer: Rohm; Voltage Rating: 20V; Leakage Current: 700nA; Supplier 1: Digi-Key; Manufacturer Part Number: TCTU1D334M8R; RoHS: Yes; Category: Tantalum Capacitors; Stock 1: 28079; Pricing 1: 1=0.52000, 10=0.36800, 50=0.27800, 100=0.24220, 500=0.17940, 1000=0.15249, 2500=0.14352, 5000=0.13455 (USD); Mount: Surface Mount; Case/Package: 0402; Case Code (Metric): 1005; Case Code (Imperial): 0402; Min Operating Temperature: -55°C; Max Operating Temperature: 125°C; Package Quantity: 10000; Packaging: Tape and Reel; Capacitance: 330nF; Tolerance: 20%; Termination: SMD/SMT; Dissipation Factor: 20%; Voltage Rating (DC): 20V; Features: General Purpose; Length: 0.039inch; Width: 0.5mm; Height: 0.6mm; Height - Seated (Max): 0.024inch; Lead Free: Lead Free; RoHS Compliant: Yes; ComponentLink1URL: https://datasheet.ciiva.com/29503/tct-u-29503913.pdf?src-supplier=Digi-Key; ComponentLink1Description: https://datasheet.ciiva.com/29503/tct-u-29503913.pdf?src-supplier=Digi-Key; ComponentLink2URL: https://datasheet.ciiva.com/29503/tct-u-29503914.pdf?src-supplier=Digi-Key; ComponentLink2Description: https://datasheet.ciiva.com/29503/tct-u-29503914.pdf?src-supplier=Digi-Key; ComponentLink3URL: https://datasheet.ciiva.com/29503/tct-u-29503915.pdf?src-supplier=Digi-Key; ComponentLink3Description: https://datasheet.ciiva.com/29503/tct-u-29503915.pdf?src-supplier=Digi-Key; Supplier Part Number 1: 511-1684-1-ND
J#1 = WJ301V-5.0-2P: as J8 on sheet Connector_Section; Manufacturer Part No: WJ301V-5.0-2P; Package: Custom
R3 R4 R10 = RC0402JR-0720KL: as R9 on sheet Controller_Section; Supplier 1: Digi-Key; Manufacturer Part Number: RC0402JR-0720KL; Stock 1: 4817510; Pricing 1: 1=0.1, 10=0.013, 100=0.0053, 1000=0.00236, 2500=0.00205, 5000=0.00169 (USD); Case/Package: 0402; Number of Pins: 2; Case Code (Metric): 1005; Case Code (Imperial): 0402; Min Operating Temperature: -55°C; Max Operating Temperature: 155°C; Package Quantity: 1; Tolerance: 5%; Packaging: Tape and Reel; Composition: Thick Film; Number of Terminations: 2; Termination: SMD/SMT; Military Standard: Not; Voltage Rating (DC): 50V; Features: Moisture Resistant; Length: 0.039inch; Height: 0.016inch; Width: 0.02inch; Depth: 0.5mm; REACH SVHC: No SVHC; Lead Free: Lead Free; ComponentLink1URL: http://www.yageo.com/documents/recent/PYu-RC_Group_51_RoHS_L_9.pdf?src-supplier=Digi-Key; ComponentLink1Description: http://www.yageo.com/documents/recent/PYu-RC_Group_51_RoHS_L_9.pdf?src-supplier=Digi-Key; ComponentLink2URL: http://www.farnell.com/datasheets/1018594.pdf?src-supplier=Element14; ComponentLink2Description: http://www.farnell.com/datasheets/1018594.pdf?src-supplier=Element14; ComponentLink3URL: http://www.mouser.com/ds/2/447/PYu-RC0402_51_RoHS_L_6_r-8721.pdf?src-supplier=Mouser; ComponentLink3Description: http://www.mouser.com/ds/2/447/PYu-RC0402_51_RoHS_L_6_r-8721.pdf?src-supplier=Mouser; ComponentLink4URL: http://www.yageo.com/documents/recent/PYu-RC0402_51_RoHS_L_6_r.pdf?src-supplier=Future+Electronics; ComponentLink4Description: http://www.yageo.com/documents/recent/PYu-RC0402_51_RoHS_L_6_r.pdf?src-supplier=Future+Electronics; Supplier Part Number 1: 311-20KJRCT-ND
SB21 = Solder Bridge: Solder Bridge ON
U6 = LM4890MX/NOPB: IC AMP CLASS AB MONO 1W 8SOIC; Manufacturer: Texas Instruments; Manufacturer Part No: LM4890MX/NOPB; Package: SOIC-8_150mil; ComponentLink1Description: LCSC; ComponentLink1URL: https://lcsc.com/product-detail/Audio-Power-OpAmps_Texas-Instruments-LM4890MX-NOPB_C117476.html

## Sheet OLED_Section.SchDoc
size A4; DocumentNumber: 8; SheetNumber: 8; SheetTotal: 9
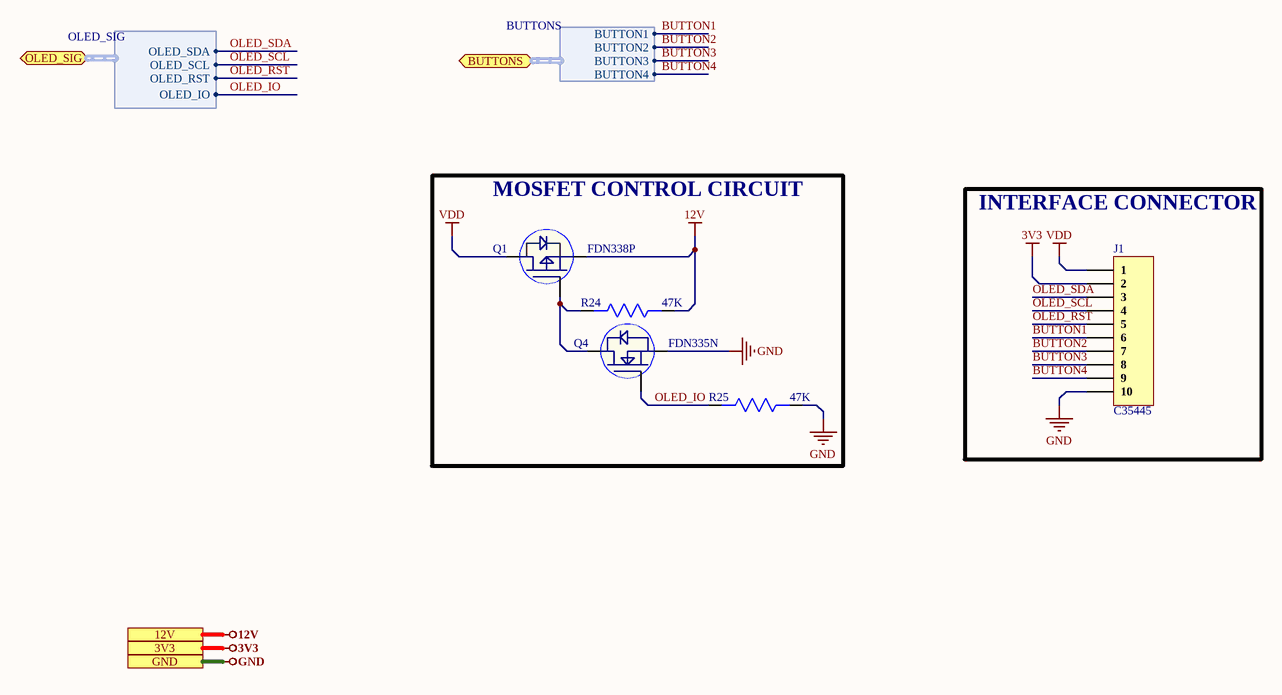
[diagram p6: OLED_Section.SchDoc]

### Parts
J1  C35445  [C35445]
Q1  FDN338P  [SOT23-3]
Q4  FDN335N  [SOT23-3]
R24  47K  [Res0402]
R25  47K  [Res0402]

### Blocks framed on the sheet
MOSFET CONTROL CIRCUIT: Q1 Q4 R24 R25
INTERFACE CONNECTOR: J1

### Ports
3V3, 12V, BUTTONS (bidir, harness BUTTONS), GND, OLED_SIG (bidir, harness OLED_SIG)

### Harnesses
OLED_SIG: OLED_SDA, OLED_SCL, OLED_RST, OLED_IO
BUTTONS: BUTTON1, BUTTON2, BUTTON3, BUTTON4

### Nets
3V3: J1.2 ; port 3V3
12V: Q1.2(S) R24.1 ; port 12V
GND: J1.10 Q4.2(S) R25.1 ; port GND
VDD: J1.1 Q1.3(D)
BUTTON1: J1.6 ; port BUTTONS.BUTTON1
BUTTON2: J1.7 ; port BUTTONS.BUTTON2
BUTTON3: J1.8 ; port BUTTONS.BUTTON3
BUTTON4: J1.9 ; port BUTTONS.BUTTON4
OLED_IO: Q4.1(G) R25.2 ; port OLED_SIG.OLED_IO
OLED_RST: J1.5 ; port OLED_SIG.OLED_RST
OLED_SCL: J1.4 ; port OLED_SIG.OLED_SCL
OLED_SDA: J1.3 ; port OLED_SIG.OLED_SDA
NetQ1_1: Q1.1(G) Q4.3(D) R24.2

### Notes on the sheet
- 1
- Huzaifa Ali

### Library data of the parts
J1 = C35445: 2.54mm Straight 1x10P 10 1 Plugin,P=2.54mm Female Headers ROHS; Manufacturer: BOOMELE; ComponentLink1Description: LCSC; ComponentLink1URL: https://lcsc.com/product-detail/span-style-background-color-ff0-Female-span-Headers_BOOMELE-Boom-Precision-Elec-C35445_C35445.html; Manufacturer Part No: C35445; Package: Custom
Q1 = FDN338P: 20V 1.6A 500mW 115mΩ@4.5V,1.6A 1.5V@250μA P Channel SOT-23 MOSFETs ROHS; Manufacturer: UMW; Manufacturer Part No: FDN338P; Package: SOT-23
Q4 = FDN335N: SOT-23 MOSFETs ROHS; Manufacturer: UMW; Manufacturer Part No: FDN335N; Package: SOT-23; Value: *; ComponentLink1Description: LCSC; ComponentLink1URL: https://lcsc.com/product-detail/MOSFETs_UMW-Youtai-Semiconductor-Co-Ltd-FDN335N_C347512.html
R24 R25 = RC0402FR-0747KL: RES SMD 47K OHM 1% 1/16W 0402; Manufacturer: Yageo; Power Rating: 62.5mW; Temperature Coefficient: 100ppm/°C; Voltage Rating: 50V; Resistance: 47kR; Max Power Dissipation: 63mW; Supplier 1: Digi-Key; Manufacturer Part Number: RC0402FR-0747KL; Stock 1: 0; Pricing 1: 1=0.1, 10=0.016, 100=0.0064, 1000=0.00289, 2500=0.00251, 5000=0.00207 (USD); Case/Package: 0402; Case Code (Imperial): 0402; Case Code (Metric): 1005; Min Operating Temperature: -55°C; Max Operating Temperature: 155°C; Tolerance: 1%; Packaging: Tape and Reel; Package Quantity: 1; Termination: SMD/SMT; Composition: Thick Film; Number of Terminations: 2; Military Standard: Not; Features: Moisture Resistant; Length: 1mm; Height: 0.016inch; Depth: 0.5mm; Width: 0.5mm; REACH SVHC: Unknown; Lead Free: Lead Free; ComponentLink1URL: http://www.yageo.com/documents/recent/PYu-RC0402_51_RoHS_L_6_r.pdf?src-supplier=Future+Electronics; ComponentLink1Description: http://www.yageo.com/documents/recent/PYu-RC0402_51_RoHS_L_6_r.pdf?src-supplier=Future+Electronics; ComponentLink2URL: http://www.farnell.com/datasheets/1018594.pdf?src-supplier=Element14; ComponentLink2Description: http://www.farnell.com/datasheets/1018594.pdf?src-supplier=Element14; ComponentLink3URL: https://www.verical.com/server-webapp/html/getDatasheet?partID=323748&src-supplier=Verical; ComponentLink3Description: https://www.verical.com/server-webapp/html/getDatasheet?partID=323748&src-supplier=Verical; ComponentLink4URL: http://www.yageo.com/documents/recent/PYu-RC_Group_51_RoHS_L_10.pdf?src-supplier=Digi-Key; ComponentLink4Description: http://www.yageo.com/documents/recent/PYu-RC_Group_51_RoHS_L_10.pdf?src-supplier=Digi-Key; Supplier Part Number 1: 311-47.0KLRDKR-ND

## Nets that join several sheets
3V3: Power_Section (C2.1 R1.2 U1.3), Peripheral_Section (8 pins), Controller_Section (14 pins), Connector_Section (C29.1 J4.1 J5.1), Audio_Amplifier_Section (C8.1 R3.2 U6.6), OLED_Section (J1.2)
3V3ZD: Power_Section (D3.A), Peripheral_Section (8 pins), Connector_Section (S1.2)
12V: Peripheral_Section (8 pins), Connector_Section (J7.1 P16.1), OLED_Section (Q1.2 R24.1)
COIN_VBAT: Peripheral_Section (U8.3), Connector_Section (J6.1 P13.1)
GND: Power_Section (5 pins), Peripheral_Section (24 pins), Controller_Section (14 pins), Connector_Section (17 pins), Audio_Amplifier_Section (C8.2 C19.2 U6.7), OLED_Section (J1.10 Q4.2 R25.1)
VSUB: Power_Section (D1.A), Connector_Section (C30.1 C31.1 J3.1)
AMP.SHDN: Controller_Section (U5.9), Audio_Amplifier_Section (R3.1 U6.1)
AMP.VOUT: Controller_Section (U5.3), Audio_Amplifier_Section (C50.2)
B_IN1: Peripheral_Section (U7.1), Controller_Section (U5.24)
B_IN2: Peripheral_Section (U7.2), Controller_Section (U5.27)
BST_EN: Peripheral_Section (Q3.1 R11.1), Controller_Section (U5.7)
BUTTON1: Controller_Section (R6.2 U5.14), OLED_Section (J1.6)
BUTTON2: Controller_Section (R8.2 U5.12), OLED_Section (J1.7)
BUTTON3: Controller_Section (R33.2 U5.15), OLED_Section (J1.8)
BUTTON4: Controller_Section (R34.2 U5.16), OLED_Section (J1.9)
MCU_D+: Controller_Section (U5.34), Connector_Section (RF23.1)
MCU_D-: Controller_Section (U5.33), Connector_Section (RF22.1)
MFP: Peripheral_Section (R17.1 U8.7), Controller_Section (U5.19)
nFAULT: Peripheral_Section (U7.4), Controller_Section (U5.25)
NRST_: Controller_Section (C18.1 R9.1 SW1.1 U5.40), Connector_Section (J4.10 J5.10)
nSLEEP: Peripheral_Section (R12.2 U7.3), Controller_Section (U5.26)
OLED_IO: Controller_Section (U5.28), OLED_Section (Q4.1 R25.2)
OLED_RST: Controller_Section (U5.29), OLED_Section (J1.5)
OLED_SCL: Controller_Section (U5.22), OLED_Section (J1.4)
OLED_SDA: Controller_Section (U5.21), OLED_Section (J1.3)
OUT_1: Peripheral_Section (U7.8), Connector_Section (J8.1 P14.1)
OUT_2: Peripheral_Section (U7.10), Connector_Section (J8.2 P15.1)
SCL_: Peripheral_Section (R16.1 U8.6), Controller_Section (U5.32)
SDA_: Peripheral_Section (R15.1 U8.5), Controller_Section (U5.31)
SENS_IN: Peripheral_Section (R13.2), Connector_Section (J7.2)
SWDCLK: Controller_Section (U5.45), Connector_Section (J4.4 J5.4)
SWDIO: Controller_Section (U5.46), Connector_Section (J4.2 J5.2)
VDR_Out: Peripheral_Section (R13.1 R14.1), Controller_Section (U5.47)
VPROP: Peripheral_Section (R2.2 U7.6), Controller_Section (U5.48)